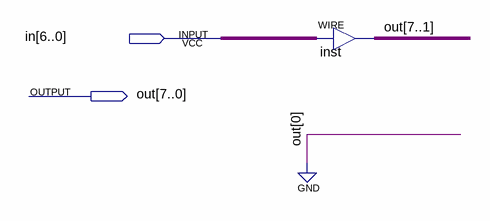
[diagram p0: schematic sheet]
// Quartus schematic shiftLeft.bdf as structural Verilog: 1 symbols, 2 pins
module shiftLeft (
  input  [6:0] in,
  output [7:0] out
);

  assign out[7:1] = in;  // WIRE inst

  assign out[0] = 1'b0;
endmodule
